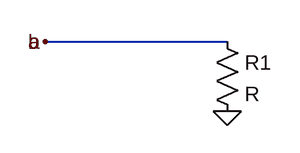
[diagram p0: schematic etiquetas-varias-mismo-punto.asc]
etiquetas-varias-mismo-punto.asc, the LTspice schematic file:
Version 4
SHEET 1 880 680
WIRE 0 0 208 0
FLAG 0 0 b
FLAG 0 0 a
FLAG 208 80 0
SYMBOL res 192 -16 R0
SYMATTR InstName R1

The netlist it stands for:
* etiquetas-varias-mismo-punto.asc
R1 a 0 R
.backanno
.end